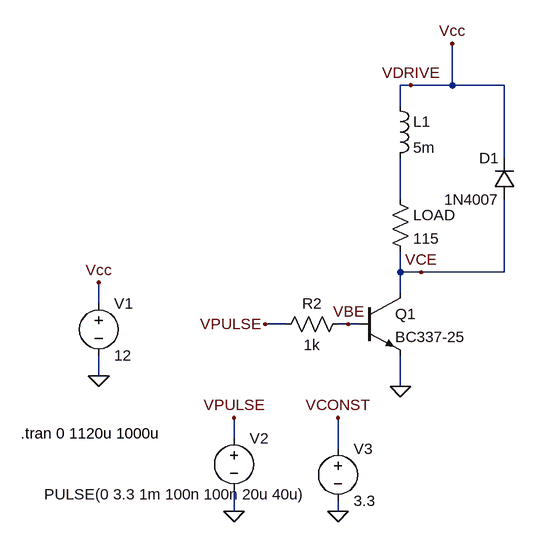
[diagram p0: schematic thermal.asc]
thermal.asc, the LTspice schematic file:
Version 4.1
SHEET 1 880 680
WIRE 512 -208 496 -208
WIRE 576 -208 576 -272
WIRE 576 -208 512 -208
WIRE 656 -208 576 -208
WIRE 496 -176 496 -208
WIRE 656 -96 656 -208
WIRE 496 -32 496 -96
WIRE 496 80 496 48
WIRE 528 80 496 80
WIRE 656 80 656 -32
WIRE 656 80 528 80
WIRE 496 112 496 80
WIRE 32 128 32 96
WIRE 320 160 288 160
WIRE 416 160 400 160
WIRE 432 160 416 160
WIRE 32 240 32 208
WIRE 496 256 496 208
WIRE 240 336 240 304
WIRE 400 352 400 304
WIRE 240 448 240 416
WIRE 400 448 400 432
FLAG 32 240 0
FLAG 32 96 Vcc
FLAG 576 -272 Vcc
FLAG 496 256 0
FLAG 416 160 VBE
FLAG 528 80 VCE
FLAG 512 -208 VDRIVE
FLAG 240 448 0
FLAG 240 304 VPULSE
FLAG 400 448 0
FLAG 400 304 VCONST
FLAG 288 160 VPULSE
SYMBOL voltage 32 112 R0
WINDOW 123 0 0 Left 0
WINDOW 39 0 0 Left 0
SYMATTR InstName V1
SYMATTR Value 12
SYMBOL npn 432 112 R0
SYMATTR InstName Q1
SYMATTR Value BC337-25
SYMBOL ind 480 -192 R0
SYMATTR InstName L1
SYMATTR Value 5m
SYMATTR SpiceLine Rser=1m
SYMBOL res 480 -48 R0
SYMATTR InstName LOAD
SYMATTR Value 115
SYMBOL diode 672 -32 R180
WINDOW 0 24 64 Left 2
WINDOW 3 24 0 Left 2
SYMATTR InstName D1
SYMATTR Value 1N4007
SYMBOL voltage 240 320 R0
WINDOW 3 -292 102 Left 2
WINDOW 123 0 0 Left 0
WINDOW 39 0 0 Left 0
SYMATTR InstName V2
SYMATTR Value PULSE(0 3.3 1m 100n 100n 20u 40u)
SYMBOL res 416 144 R90
WINDOW 0 0 56 VBottom 2
WINDOW 3 32 56 VTop 2
SYMATTR InstName R2
SYMATTR Value 1k
SYMBOL voltage 400 336 R0
WINDOW 123 0 0 Left 0
WINDOW 39 0 0 Left 0
SYMATTR InstName V3
SYMATTR Value 3.3
TEXT -88 328 Left 2 !.tran 0 1120u 1000u

The netlist it stands for:
* thermal.asc
V1 VDRIVE 0 12
Q1 VCE VBE 0 0 BC337-25
L1 VDRIVE N001 5m Rser=1m
R§LOAD N001 VCE 115
D1 VCE VDRIVE 1N4007
V2 VPULSE 0 PULSE(0 3.3 1m 100n 100n 20u 40u)
R2 VBE VPULSE 1k
V3 VCONST 0 3.3
.model D D
.lib standard.dio
.model NPN NPN
.model PNP PNP
.lib standard.bjt
.tran 0 1120u 1000u
.backanno
.end